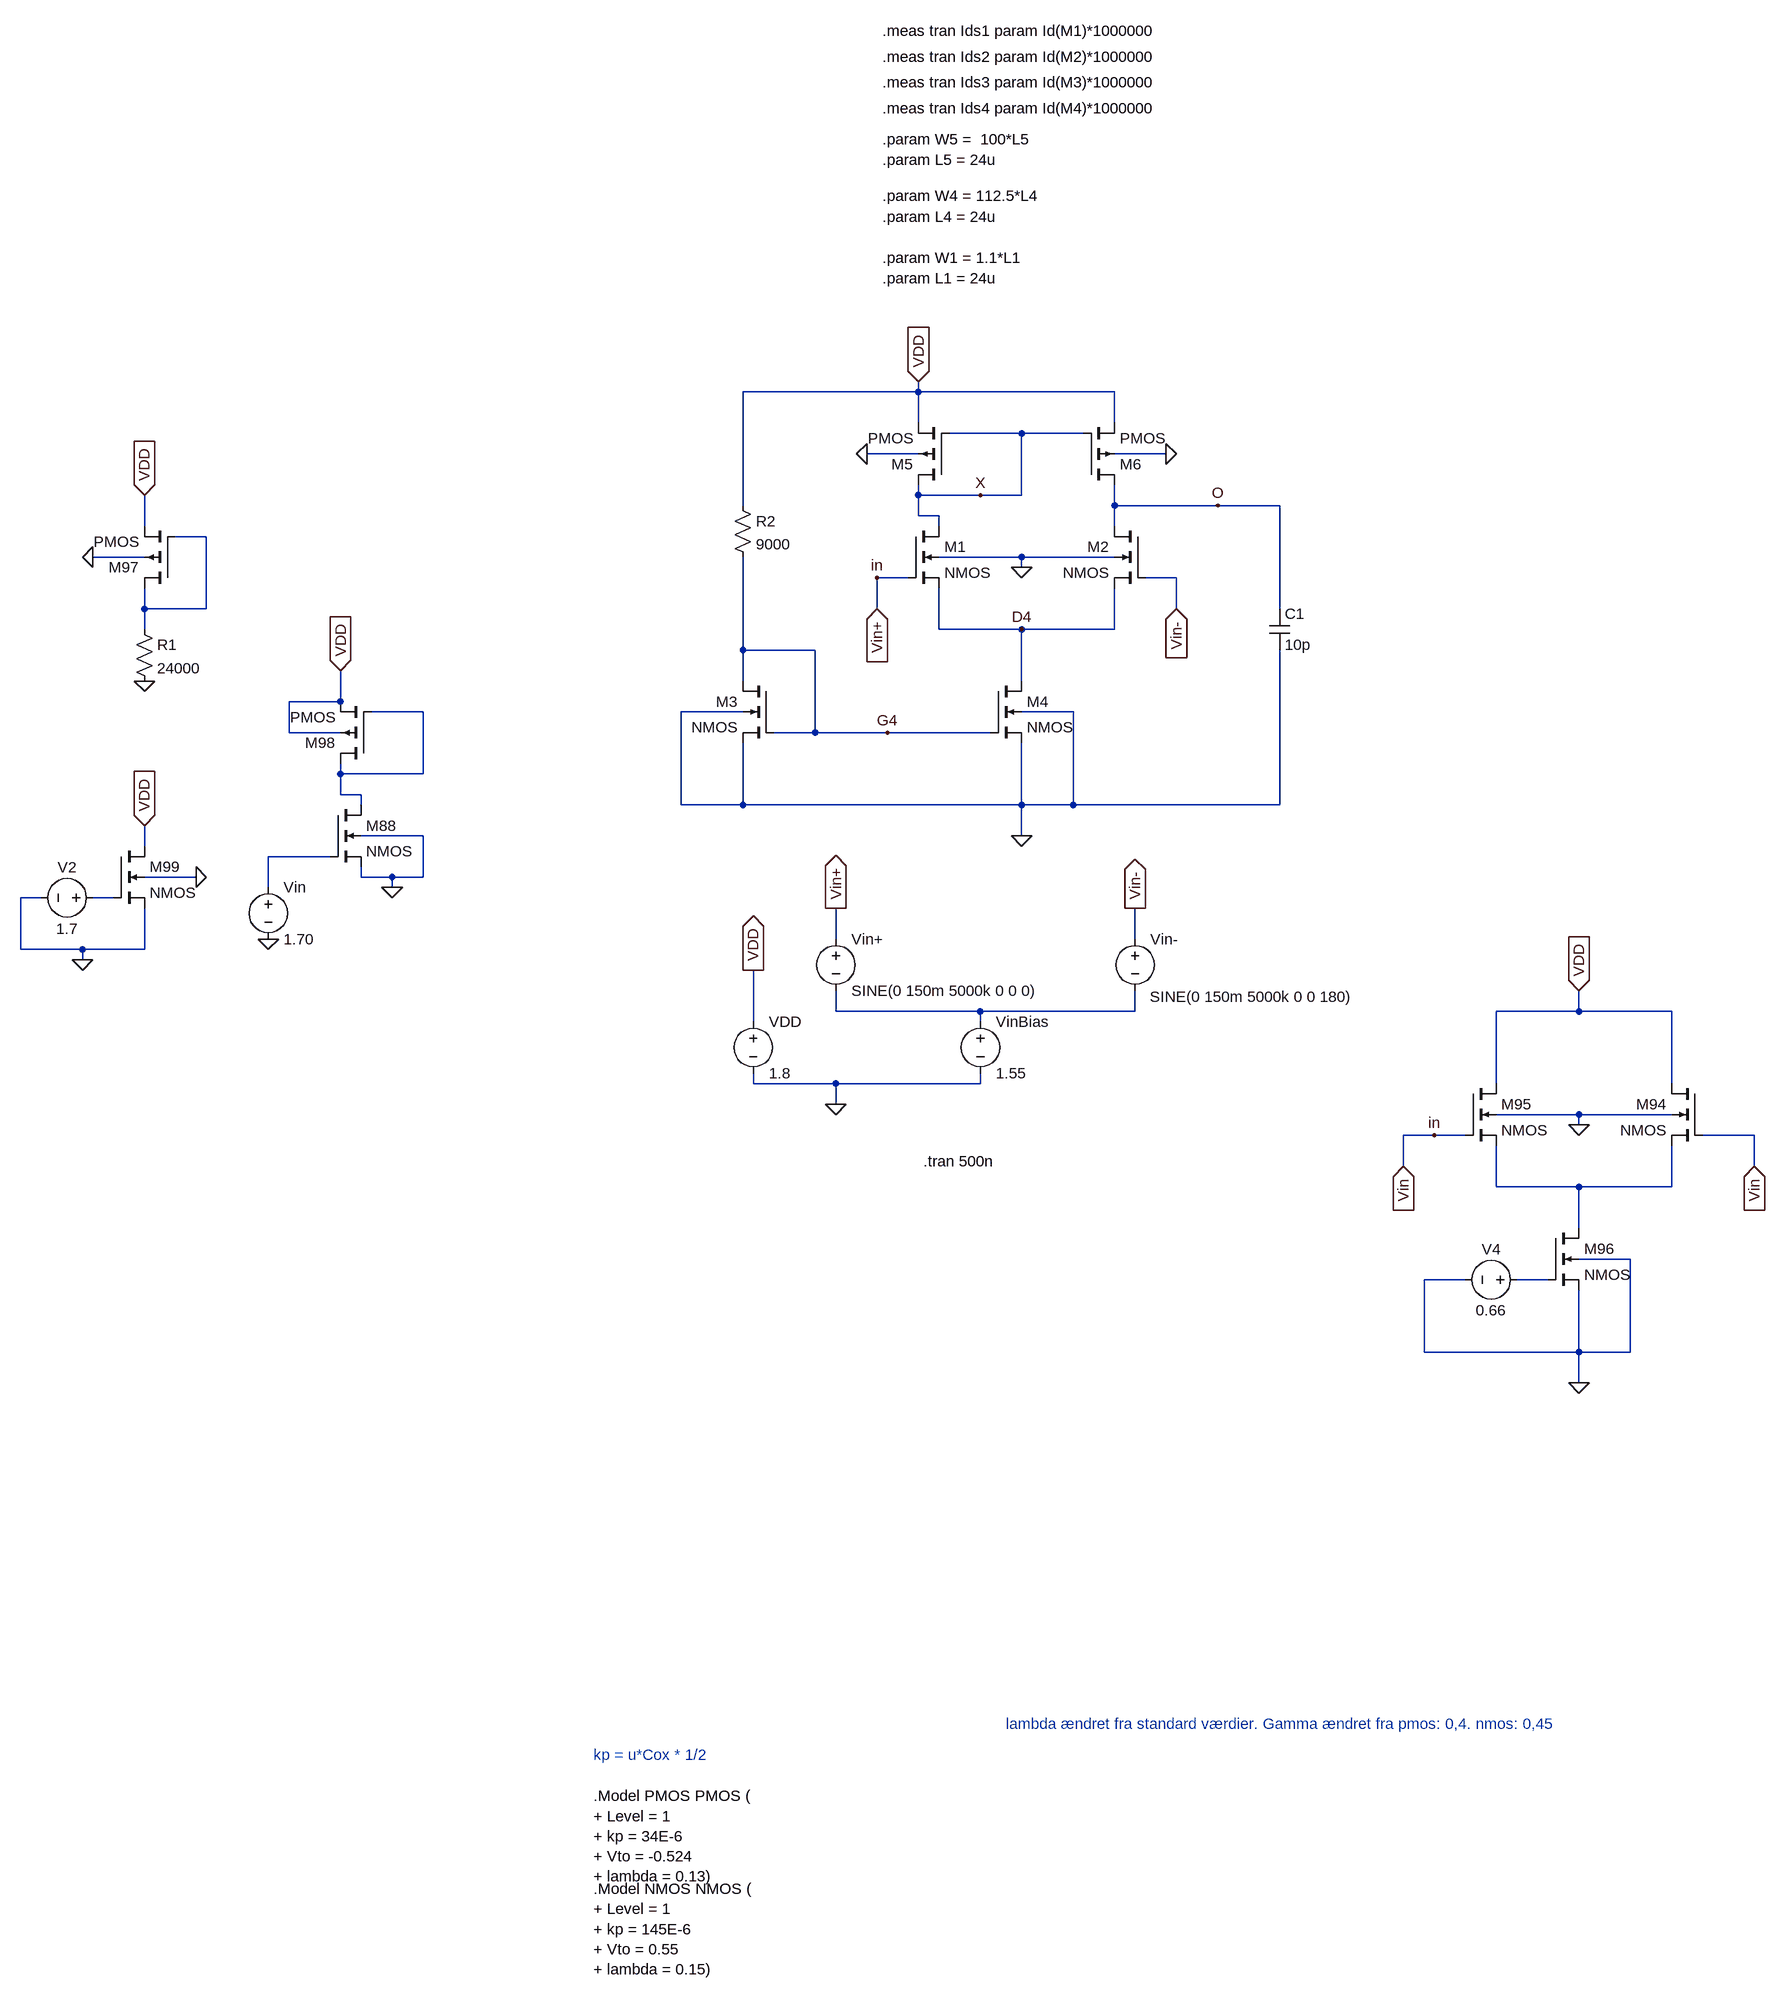
[diagram p0: schematic Design.asc]
Design.asc, the LTspice schematic file:
Version 4
SHEET 1 2684 1080
WIRE 544 -1440 544 -1456
WIRE 544 -1440 272 -1440
WIRE 848 -1440 544 -1440
WIRE 544 -1392 544 -1440
WIRE 848 -1392 848 -1440
WIRE 704 -1376 592 -1376
WIRE 800 -1376 704 -1376
WIRE 544 -1344 464 -1344
WIRE 928 -1344 848 -1344
WIRE 544 -1280 544 -1296
WIRE 640 -1280 544 -1280
WIRE 704 -1280 704 -1376
WIRE 704 -1280 640 -1280
WIRE 272 -1264 272 -1440
WIRE 848 -1264 848 -1296
WIRE 1008 -1264 848 -1264
WIRE 1104 -1264 1008 -1264
WIRE 544 -1248 544 -1280
WIRE 576 -1248 544 -1248
WIRE -656 -1232 -656 -1280
WIRE 576 -1232 576 -1248
WIRE 848 -1232 848 -1264
WIRE -560 -1216 -608 -1216
WIRE -656 -1184 -736 -1184
WIRE 704 -1184 576 -1184
WIRE 848 -1184 704 -1184
WIRE 704 -1168 704 -1184
WIRE 528 -1152 480 -1152
WIRE 944 -1152 896 -1152
WIRE -656 -1104 -656 -1136
WIRE -560 -1104 -560 -1216
WIRE -560 -1104 -656 -1104
WIRE 480 -1104 480 -1152
WIRE 944 -1104 944 -1152
WIRE 1104 -1104 1104 -1264
WIRE -656 -1072 -656 -1104
WIRE 576 -1072 576 -1136
WIRE 704 -1072 576 -1072
WIRE 848 -1072 848 -1136
WIRE 848 -1072 704 -1072
WIRE 272 -1040 272 -1184
WIRE 384 -1040 272 -1040
WIRE 272 -992 272 -1040
WIRE 704 -992 704 -1072
WIRE -352 -960 -352 -1008
WIRE -352 -960 -432 -960
WIRE -224 -944 -304 -944
WIRE 272 -944 176 -944
WIRE 784 -944 704 -944
WIRE -432 -912 -432 -960
WIRE -352 -912 -432 -912
WIRE 384 -912 384 -1040
WIRE 384 -912 320 -912
WIRE 496 -912 384 -912
WIRE 656 -912 496 -912
WIRE -352 -848 -352 -864
WIRE -224 -848 -224 -944
WIRE -224 -848 -352 -848
WIRE -352 -816 -352 -848
WIRE -320 -816 -352 -816
WIRE -320 -800 -320 -816
WIRE 176 -800 176 -944
WIRE 272 -800 272 -896
WIRE 272 -800 176 -800
WIRE 704 -800 704 -896
WIRE 704 -800 272 -800
WIRE 784 -800 784 -944
WIRE 784 -800 704 -800
WIRE 1104 -800 1104 -1040
WIRE 1104 -800 784 -800
WIRE -224 -752 -320 -752
WIRE 704 -752 704 -800
WIRE -656 -736 -656 -768
WIRE -368 -720 -464 -720
WIRE -576 -688 -656 -688
WIRE -320 -688 -320 -704
WIRE -272 -688 -320 -688
WIRE -224 -688 -224 -752
WIRE -224 -688 -272 -688
WIRE -464 -672 -464 -720
WIRE -272 -672 -272 -688
WIRE -816 -656 -848 -656
WIRE -704 -656 -736 -656
WIRE 416 -592 416 -640
WIRE 880 -592 880 -640
WIRE -848 -576 -848 -656
WIRE -752 -576 -848 -576
WIRE -656 -576 -656 -640
WIRE -656 -576 -752 -576
WIRE -752 -560 -752 -576
WIRE 416 -480 416 -512
WIRE 640 -480 416 -480
WIRE 880 -480 880 -512
WIRE 880 -480 640 -480
WIRE 1568 -480 1568 -512
WIRE 1568 -480 1440 -480
WIRE 1712 -480 1568 -480
WIRE 288 -464 288 -544
WIRE 640 -464 640 -480
WIRE 288 -368 288 -384
WIRE 416 -368 288 -368
WIRE 640 -368 640 -384
WIRE 640 -368 416 -368
WIRE 1440 -368 1440 -480
WIRE 1712 -368 1712 -480
WIRE 416 -336 416 -368
WIRE 1568 -320 1440 -320
WIRE 1712 -320 1568 -320
WIRE 1568 -304 1568 -320
WIRE 1344 -288 1296 -288
WIRE 1392 -288 1344 -288
WIRE 1840 -288 1760 -288
WIRE 1296 -240 1296 -288
WIRE 1840 -240 1840 -288
WIRE 1440 -208 1440 -272
WIRE 1568 -208 1440 -208
WIRE 1712 -208 1712 -272
WIRE 1712 -208 1568 -208
WIRE 1568 -144 1568 -208
WIRE 1648 -96 1568 -96
WIRE 1392 -64 1328 -64
WIRE 1520 -64 1472 -64
WIRE 1328 48 1328 -64
WIRE 1568 48 1568 -48
WIRE 1568 48 1328 48
WIRE 1648 48 1648 -96
WIRE 1648 48 1568 48
WIRE 1568 96 1568 48
FLAG 416 -336 0
FLAG 288 -544 VDD
IOPIN 288 -544 Out
FLAG 416 -640 Vin+
IOPIN 416 -640 Out
FLAG 880 -640 Vin-
IOPIN 880 -640 Out
FLAG -272 -672 0
FLAG -464 -592 0
FLAG -752 -560 0
FLAG -656 -768 VDD
IOPIN -656 -768 In
FLAG -576 -688 0
FLAG -656 -1280 VDD
IOPIN -656 -1280 In
FLAG -736 -1184 0
FLAG -352 -1008 VDD
IOPIN -352 -1008 In
FLAG -656 -992 0
FLAG 640 -1280 X
FLAG 480 -1152 in
FLAG 928 -1344 0
FLAG 544 -1456 VDD
IOPIN 544 -1456 In
FLAG 704 -1168 0
FLAG 704 -752 0
FLAG 480 -1104 Vin+
IOPIN 480 -1104 In
FLAG 944 -1104 Vin-
IOPIN 944 -1104 In
FLAG 1008 -1264 O
FLAG 1568 96 0
FLAG 1344 -288 in
FLAG 1568 -304 0
FLAG 1296 -240 Vin
IOPIN 1296 -240 In
FLAG 1840 -240 Vin
IOPIN 1840 -240 In
FLAG 1568 -512 VDD
IOPIN 1568 -512 In
FLAG 704 -1072 D4
FLAG 496 -912 G4
FLAG 464 -1344 0
SYMBOL Voltage 288 -480 R0
SYMATTR InstName VDD
SYMATTR Value 1.8
SYMBOL Voltage 640 -480 R0
SYMATTR InstName VinBias
SYMATTR Value 1.55
SYMBOL Voltage 416 -608 R0
SYMATTR InstName Vin+
SYMATTR Value SINE(0 150m 5000k 0 0 0)
SYMBOL Voltage 880 -608 R0
WINDOW 3 23 105 Left 2
SYMATTR Value SINE(0 150m 5000k 0 0 180)
SYMATTR InstName Vin-
SYMBOL pmos4 -304 -864 R180
SYMATTR InstName M98
SYMATTR Value2 l=18u w=9000u
SYMBOL nmos4 -368 -800 R0
SYMATTR InstName M88
SYMATTR Value2 l=24.48u w=12.24u
SYMBOL Voltage -464 -688 R0
SYMATTR InstName Vin
SYMATTR Value 1.70
SYMBOL Voltage -720 -656 R90
WINDOW 0 -32 56 VBottom 2
WINDOW 3 32 56 VTop 2
SYMATTR InstName V2
SYMATTR Value 1.7
SYMBOL nmos4 -704 -736 R0
SYMATTR InstName M99
SYMATTR Value2 l=24u w=12.24u
SYMBOL pmos4 -608 -1136 R180
SYMATTR InstName M97
SYMATTR Value2 l=18u w=9000u
SYMBOL Res -672 -1088 R0
SYMATTR InstName R1
SYMATTR Value 24000
SYMBOL pmos4 592 -1296 R180
SYMATTR InstName M5
SYMATTR Value2 l=L5 w=W5
SYMBOL nmos4 528 -1232 R0
SYMATTR InstName M1
SYMATTR Value2 l=L1 w=W1
SYMBOL pmos4 800 -1296 M180
SYMATTR InstName M6
SYMATTR Value2 l=L5 w=W5
SYMBOL nmos4 896 -1232 M0
SYMATTR InstName M2
SYMATTR Value2 l=L1 w=W1
SYMBOL nmos4 656 -992 R0
SYMATTR InstName M4
SYMATTR Value2 l=L4 w=W4
SYMBOL Cap 1088 -1104 R0
SYMATTR InstName C1
SYMATTR Value 10p
SYMBOL nmos4 1520 -144 R0
SYMATTR InstName M96
SYMATTR Value2 l=24u w=2700u
SYMBOL Voltage 1488 -64 R90
WINDOW 0 -32 56 VBottom 2
WINDOW 3 32 56 VTop 2
SYMATTR InstName V4
SYMATTR Value 0.66
SYMBOL nmos4 1392 -368 R0
SYMATTR InstName M95
SYMATTR Value2 l=L1 w=W1
SYMBOL nmos4 1760 -368 M0
SYMATTR InstName M94
SYMATTR Value2 l=L1 w=W1
SYMBOL nmos4 320 -992 M0
SYMATTR InstName M3
SYMATTR Value2 l=L4 w=W4
SYMBOL Res 256 -1280 R0
SYMATTR InstName R2
SYMATTR Value 9000
TEXT 680 624 Left 2 ;lambda ændret fra standard værdier. Gamma ændret fra pmos: 0,4. nmos: 0,45
TEXT 552 -248 Left 2 !.tran 500n
TEXT 40 736 Left 2 !.Model PMOS PMOS (\n+ Level = 1 \n+ kp = 34E-6 \n+ Vto = -0.524\n+ lambda = 0.13)
TEXT 40 880 Left 2 !.Model NMOS NMOS (\n+ Level = 1\n+ kp = 145E-6\n+ Vto = 0.55 \n+ lambda = 0.15)
TEXT 40 672 Left 2 ;kp = u*Cox * 1/2
TEXT 488 -2000 Left 2 !.meas tran Ids1 param Id(M1)*1000000
TEXT 488 -1832 Left 2 !.param W5 =  100*L5
TEXT 488 -1800 Left 2 !.param L5 = 24u
TEXT 488 -1616 Left 2 !.param L1 = 24u
TEXT 488 -1648 Left 2 !.param W1 = 1.1*L1
TEXT 488 -1712 Left 2 !.param L4 = 24u
TEXT 488 -1744 Left 2 !.param W4 = 112.5*L4
TEXT 488 -1920 Left 2 !.meas tran Ids3 param Id(M3)*1000000
TEXT 488 -1960 Left 2 !.meas tran Ids2 param Id(M2)*1000000
TEXT 488 -1880 Left 2 !.meas tran Ids4 param Id(M4)*1000000

The netlist it stands for:
* Design.asc
VDD VDD 0 1.8
VinBias N005 0 1.55
Vin+ Vin N005 SINE(0 150m 5000k 0 0 0)
Vin- Vin- N005 SINE(0 150m 5000k 0 0 180)
M98 N002 N002 VDD VDD PMOS l=18u w=9000u
M88 N002 N003 0 0 NMOS l=24.48u w=12.24u
Vin N003 0 1.70
V2 N004 0 1.7
M99 VDD N004 0 0 NMOS l=24u w=12.24u
M97 N001 N001 VDD 0 PMOS l=18u w=9000u
R1 N001 0 24000
M5 X X VDD 0 PMOS l=L5 w=W5
M1 X Vin D4 0 NMOS l=L1 w=W1
M6 O X VDD 0 PMOS l=L5 w=W5
M2 O Vin- D4 0 NMOS l=L1 w=W1
M4 D4 G4 0 0 NMOS l=L4 w=W4
C1 O 0 10p
M96 N006 N007 0 0 NMOS l=24u w=2700u
V4 N007 0 0.66
M95 VDD Vin N006 0 NMOS l=L1 w=W1
M94 VDD Vin N006 0 NMOS l=L1 w=W1
M3 G4 G4 0 0 NMOS l=L4 w=W4
R2 VDD G4 9000
.model NMOS NMOS
.model PMOS PMOS
.lib standard.mos
* lambda ændret fra standard værdier. Gamma ændret fra pmos: 0,4. nmos: 0,45
.tran 500n
.Model PMOS PMOS (
+ Level = 1
+ kp = 34E-6
+ Vto = -0.524
+ lambda = 0.13)
.Model NMOS NMOS (
+ Level = 1
+ kp = 145E-6
+ Vto = 0.55
+ lambda = 0.15)
* kp = u*Cox * 1/2
.meas tran Ids1 param Id(M1)*1000000
.param W5 =  100*L5
.param L5 = 24u
.param L1 = 24u
.param W1 = 1.1*L1
.param L4 = 24u
.param W4 = 112.5*L4
.meas tran Ids3 param Id(M3)*1000000
.meas tran Ids2 param Id(M2)*1000000
.meas tran Ids4 param Id(M4)*1000000
.backanno
.end